# Altium schematic sheet PowerSupply.SchDoc
size A4; SheetNumber: 3; SheetTotal: 6
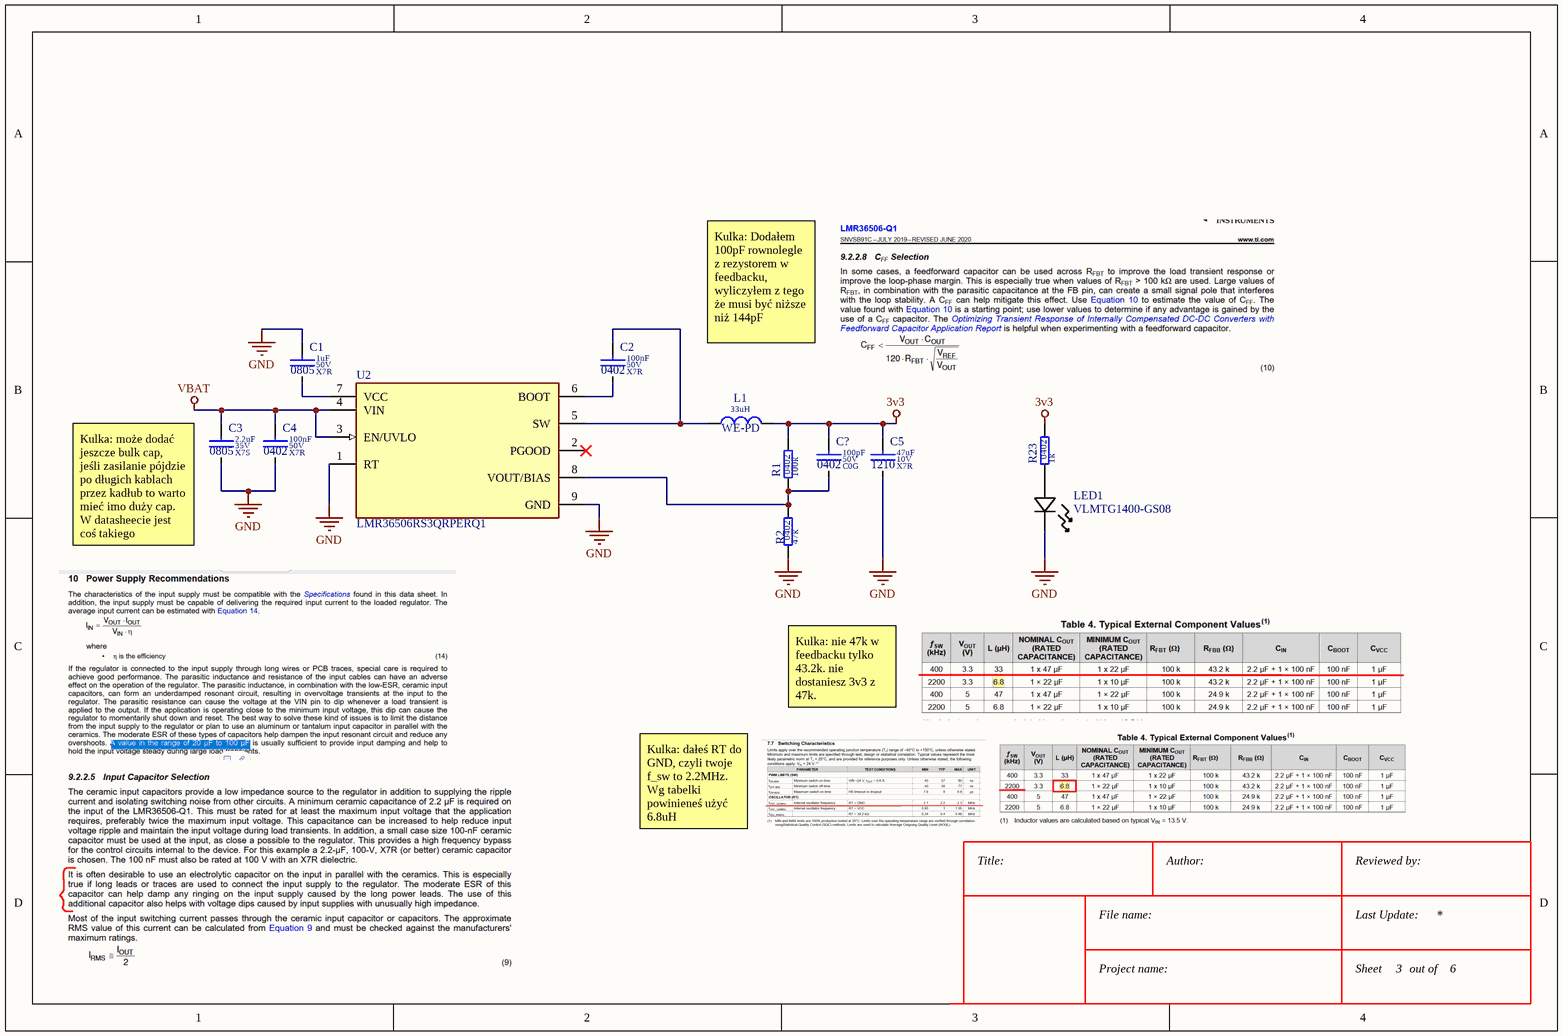
[diagram p0: PowerSupply.SchDoc]

## Parts
C1  value 1uF  Dielectric: X7R  Voltage: 50V  SCH_Footprint: 0805  [C_0805_2012]  (hidden comment: Ceramic X7R)
C2  value 100nF  Dielectric: X7R  Voltage: 50V  SCH_Footprint: 0402  [C_0402_1005]  (hidden comment: Ceramic X7R)
C3  value 2.2uF  Dielectric: X7S  Voltage: 35V  SCH_Footprint: 0805  [C_0805_2012]  (hidden comment: Ceramic X7S)
C4  value 100nF  Dielectric: X7R  Voltage: 50V  SCH_Footprint: 0402  [C_0402_1005]  (hidden comment: Ceramic X7R)
C5  value 47uF  Dielectric: X7R  Voltage: 10V  SCH_Footprint: 1210  [C_1210_3225]  (hidden comment: Ceramic X7R)
C?  value 100pF  Dielectric: C0G  Voltage: 50V  SCH_Footprint: 0402  [C_0402_1005]  (hidden comment: Ceramic C0G)
L1  value 33uH  SCH_Footprint: WE-PD  [WE-PD_1210]  (hidden comment: Inductor)
LED1  VLMTG1400-GS08  [LED_400-GS08_VIS]
R1  value 100k  SCH_Footprint: 0402  [R_0402_1005]  (hidden comment: Resistor)
R2  value 47k  SCH_Footprint: 0402  [R_0402_1005]  (hidden comment: Resistor)
R23  value 1k  SCH_Footprint: 0402  [R_0402_1005]  (hidden comment: Resistor)
U2  LMR36506RS3QRPERQ1  [FP-RPE0009A-MFG]

## Nets
3v3: C5.1 C?.1 L1.2 R1.2 R23.2
GND: C1.1 C3.2 C4.2 C5.2 LED1.1 R2.1 U2.1(RT) U2.9(GND)
VBAT: C3.1 C4.1 U2.3(EN/UVLO) U2.4(VIN)
NetC1_2: C1.2 U2.7(VCC)
NetC2_1: C2.1 L1.1 U2.5(SW)
NetC2_2: C2.2 U2.6(BOOT)
NetC?_2: C?.2 R1.1 R2.2 U2.8(VOUT/BIAS)
NetLED1_2: LED1.2 R23.1

Not connected (* = marked no-connect by the designer): U2 2(PGOOD)*

## Notes on the sheet
- Kulka: Dodałem 100pF rownolegle z rezystorem w feedbacku, wyliczyłem z tego że musi być niższe niż 144pF
- (near C3) Kulka: może dodać jeszcze bulk cap,
  jeśli zasilanie pójdzie po długich kablach przez kadłub to warto mieć imo duży cap. W datasheecie jest coś takiego
- Kulka: nie 47k w feedbacku tylko 43.2k. nie dostaniesz 3v3 z 47k.
- Kulka: dałeś RT do GND, czyli twoje f_sw to 2.2MHz. Wg tabelki powinieneś użyć 6.8uH
- Title:
- File name:
- Author:
- Reviewed by:
- Last Update:
- Project name:
- Sheet
- out of

## Library data of the parts
C1 = C_1uF_50V_X7R_0805_10: Capacitor; Manufacturer: AVX; Manufacturer Part Number: 08055C105KAT2A; Tolerance (%): 10; Part Number: C_1uF_50V_X7R_0805_10; HelpURL: https://sigma.octopart.com/147443767/technical_drawing/AVX-08055C105KAT2A.pdf; Supplier 1: TME; Supplier Part Number 1: 08055C105KAT2A; Supplier 2: RS Components; Supplier Part Number 2: 1441427; Supplier 3: Farnell; Supplier Part Number 3: 2094043; Supplier 4: Mouser; Supplier Part Number 4: 581-08055C105KAT2A; Supplier 5: Digi-Key; Supplier Part Number 5: 478-7956-1-ND; Supplier 6: LCSC
C2 C4 = C_100nF_50V_X7R_0402_10: Capacitor; Manufacturer: Murata; Manufacturer Part Number: GRM155R71H104KE14D; Tolerance (%): 10; Part Number: C_100nF_50V_X7R_0402_10; HelpURL: http://docs-europe.electrocomponents.com/webdocs/145f/0900766b8145f9d2.pdf; Supplier 1: TME; Supplier Part Number 1: GRM155R71H104KE14D; Supplier 2: RS Components; Supplier Part Number 2: 8847087; Supplier 3: Farnell; Supplier Part Number 3: 2611912; Supplier 4: Mouser; Supplier Part Number 4: 81-GRM155R71H104KE4D; Supplier 5: Digi-Key; Supplier Part Number 5: 490-10700-1-ND; Supplier 6: LCSC
C3 = C_2.2uF_35V_X7S_0805_10_AECQ1: Capacitor; Manufacturer: Murata; Manufacturer Part Number: GCM21BC7YA225KE02; Tolerance (%): 10; AEC-Q: 1; Part Number: C_2.2uF_35V_X7S_0805_10_AECQ1; HelpURL: https://www.murata.com/products/productdetail?partno=GCM21BC7YA225KE02%23; Supplier 1: TME; Supplier Part Number 1: GCM21BC7YA225KE02L; Supplier 2: RS Components; Supplier 3: Farnell; Supplier Part Number 3: 3784380; Supplier 4: Mouser; Supplier Part Number 4: 81-GCM21BC7YA225KE2L; Supplier 5: Digi-Key; Supplier Part Number 5: 490-16390-1-ND; Supplier 6: LCSC; Supplier Part Number 6: C389007
C5 = C_47uF_10V_X7R_1210_20: Capacitor; Manufacturer: Murata; Manufacturer Part Number: GRM32ER71A476ME15L; Tolerance (%): 20; Part Number: C_47uF_10V_X7R_1210_20; HelpURL: http://www.mouser.com/ds/2/281/c02e-2905.pdf; Supplier 1: TME; Supplier Part Number 1: GRM32ER71A476ME15L; Supplier 2: RS Components; Supplier Part Number 2: 8202908; Supplier 3: Farnell; Supplier Part Number 3: 2362130; Supplier 4: Mouser; Supplier Part Number 4: 81-GRM32ER71A476ME5L; Supplier 5: Digi-Key; Supplier Part Number 5: 490-6543-1-ND; Supplier 6: LCSC
C? = C_100pF_50V_C0G_0402_5: Capacitor; Manufacturer: Murata; Manufacturer Part Number: GRM1555C1H101JA01D; Tolerance (%): 5; Part Number: C_100pF_50V_C0G_0402_5; HelpURL: http://www.tme.eu/en/Document/e3e731e59cc68b1ab6d46b158bb05733/MURATA_GRM.pdf; Supplier 1: TME; Supplier Part Number 1: GRM1555C1H101JA01D; Supplier 2: RS Components; Supplier Part Number 2: 7235363; Supplier 3: Farnell; Supplier Part Number 3: 2218836; Supplier 4: Mouser; Supplier Part Number 4: 81-GRM1555C1H101JA1D; Supplier 5: Digi-Key; Supplier Part Number 5: 490-5922-1-ND; Supplier 6: LCSC
L1 = L_33uH_4.2A_WE-PD: Induction; Manufacturer: Wurth; Manufacturer Part Number: 7447709330; Current: 4.2A; Resistance: 37mR; Part Number: L_33uH_4.2A_WE-PD; HelpURL: https://www.we-online.com/components/products/datasheet/7447709330.pdf; Supplier 1: TME; Supplier 2: RS Components; Supplier Part Number 2: 70996773; Supplier 3: Farnell; Supplier Part Number 3: 2082654; Supplier 4: Mouser; Supplier Part Number 4: 710-7447709330; Supplier 5: Digi-Key; Supplier Part Number 5: 732-1244-1-ND; Supplier 6: LCSC
LED1 = VLMTG1400-GS08: CHIPLED (0603) TRUEGREEN HIGHBRIGHT -e4; Manufacturer_Name: Vishay; Copyright: Copyright (C) 2025 Ultra Librarian. All rights reserved.; Manufacturer_Part_Number: VLMTG1400-GS08
R1 = R_100k_0402_1: Manufacturer: Yageo; Manufacturer Part Number: RC0402FR-07100KL; Voltage: 50V; Power: 63mW; Tolerance: 1%; Part Number: R_100k_0402_1; HelpURL: http://www.tme.eu/pl/Document/1a2bc76e2be68b3b1670068306778ce6/rc0402yageo.pdf; Supplier 1: TME; Supplier Part Number 1: RC0402FR-07100K; Supplier 2: RS Components; Supplier 3: Farnell; Supplier Part Number 3: 2131798; Supplier 4: Mouser; Supplier Part Number 4: 603-RC0402FR-07100KL; Supplier 5: Digi-Key; Supplier Part Number 5: 311-100KLRCT-ND; Supplier 6: LCSC
R2 = R_47k_0402_1: Manufacturer: Yageo; Manufacturer Part Number: RC0402FR-0747KL; Voltage: 50V; Power: 63mW; Tolerance: 1%; Part Number: R_47k_0402_1; HelpURL: https://datasheet.octopart.com/RC0402FR-0747KL-Yageo-datasheet-10408619.pdf; Supplier 1: TME; Supplier Part Number 1: RC0402FR-0747KL; Supplier 2: RS Components; Supplier 3: Farnell; Supplier Part Number 3: 2421898; Supplier 4: Mouser; Supplier Part Number 4: 603-RC0402FR-0747KL; Supplier 5: Digi-Key; Supplier Part Number 5: 311-47.0KLRCT-ND; Supplier 6: LCSC
R23 = R_1k_0402_1: Manufacturer: Yageo; Manufacturer Part Number: RC0402FR-071K; Voltage: 50V; Power: 63mW; Tolerance: 1%; Part Number: R_1k_0402_1; HelpURL: http://www.tme.eu/pl/Document/1a2bc76e2be68b3b1670068306778ce6/rc0402yageo.pdf; Supplier 1: TME; Supplier Part Number 1: RC0402FR-071K; Supplier 2: RS Components; Supplier 3: Farnell; Supplier Part Number 3: 9239235; Supplier 4: Mouser; Supplier Part Number 4: 603-RC0402FR-071KP; Supplier 5: Digi-Key; Supplier Part Number 5: 311-1.00KLRCT-ND; Supplier 6: LCSC
U2 = CMP-04918-000626-1: 3-V TO 65-V, 0.6-A BUCK CONVERTE